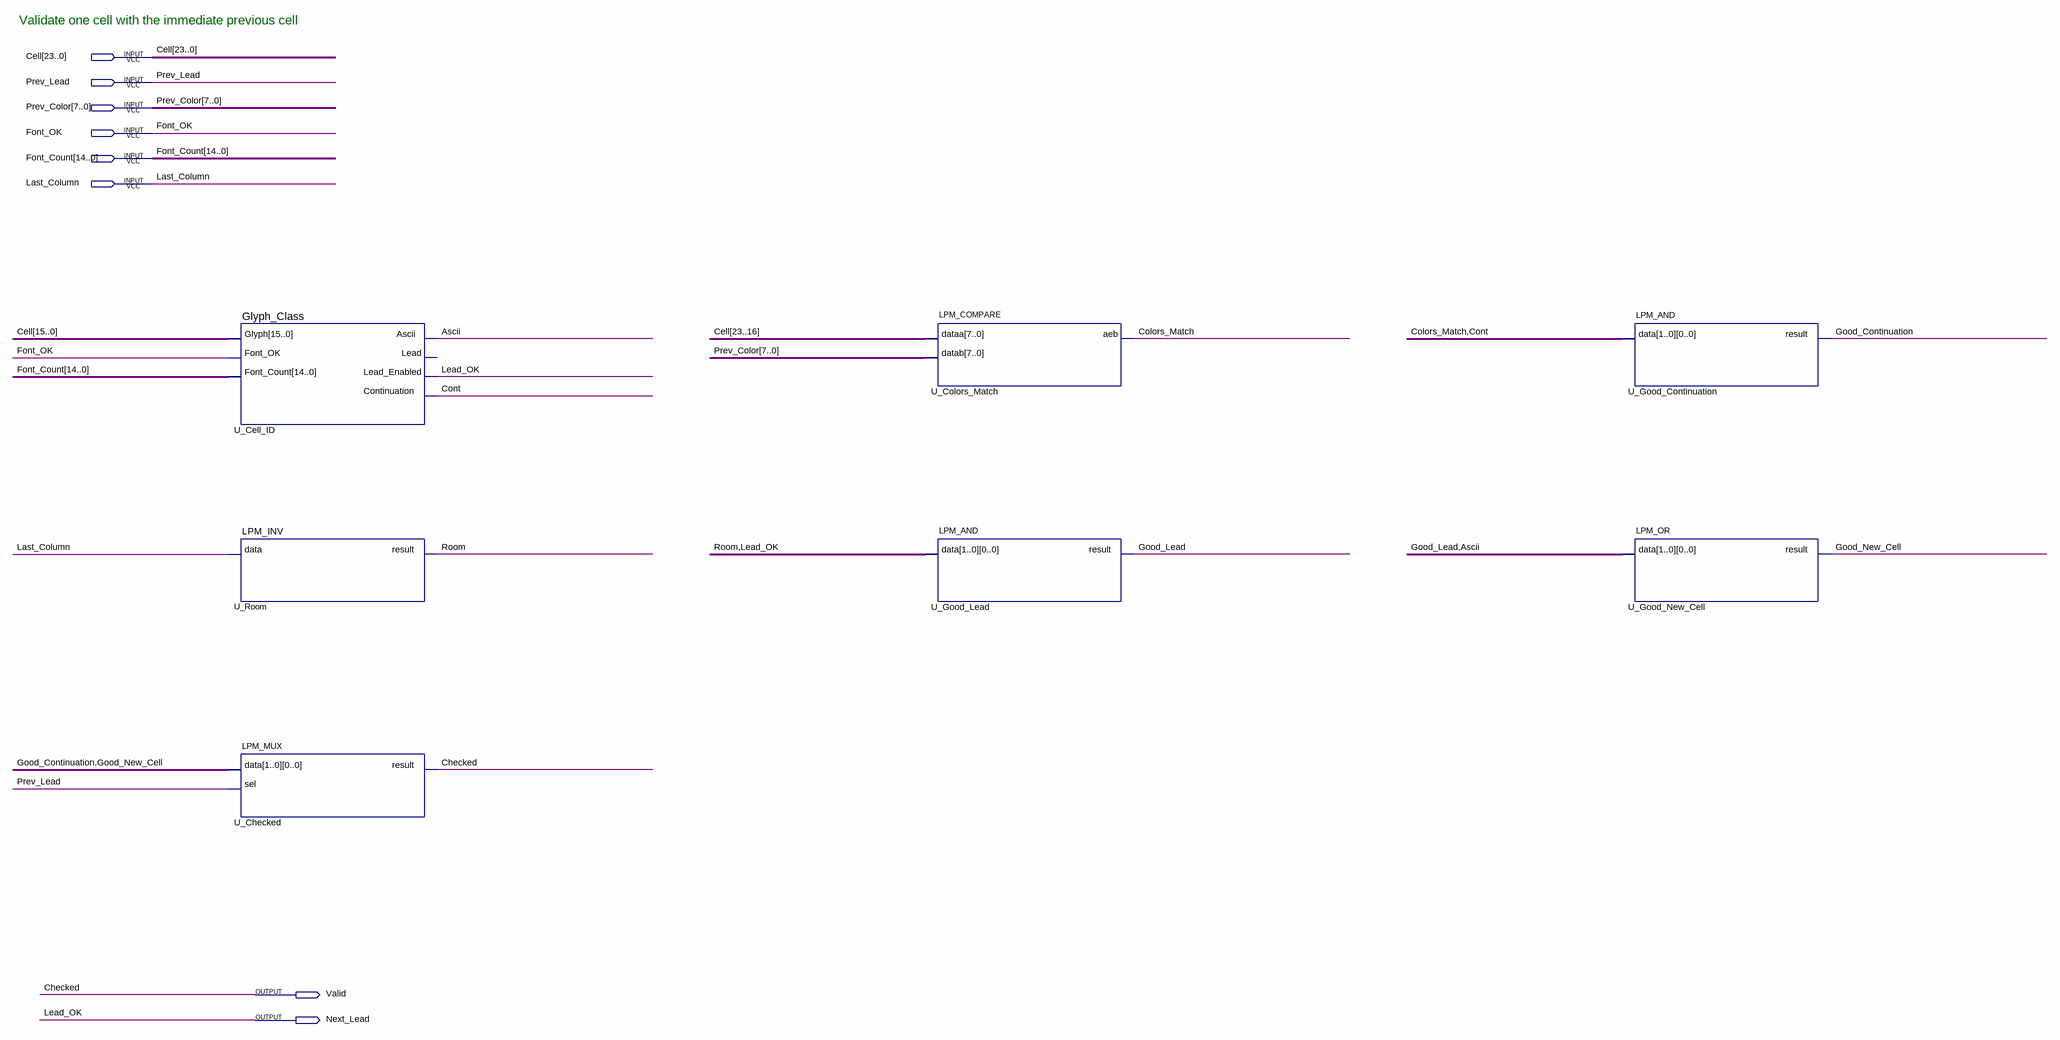
[diagram p0: schematic sheet]
// Quartus schematic Row_Check.bdf as structural Verilog: 7 symbols, 8 pins
module Row_Check (
  input  [23:0] Cell,
  input  Prev_Lead,
  input  [7:0] Prev_Color,
  input  Font_OK,
  input  [14:0] Font_Count,
  input  Last_Column,
  output Valid,
  output Next_Lead
);

  wire Ascii, Colors_Match, Cont, Good_Continuation, Good_Lead, Good_New_Cell, Room;

  Glyph_Class U_Cell_ID (
    .Glyph(Cell[15:0]), .Font_OK(Font_OK), .Font_Count(Font_Count), .Ascii(Ascii), .Lead_Enabled(Next_Lead),
    .Continuation(Cont));  // open: Lead
  LPM_INV #(.LPM_WIDTH(1)) U_Room (.data(Last_Column), .result(Room));
  LPM_MUX #(.LPM_WIDTH(1), .LPM_SIZE(2), .LPM_WIDTHS(1)) U_Checked (
    .data({Good_Continuation, Good_New_Cell}), .sel(Prev_Lead), .result(Valid));
  LPM_COMPARE #(.LPM_WIDTH(8), .LPM_REPRESENTATION("UNSIGNED")) U_Colors_Match (
    .dataa(Cell[23:16]), .datab(Prev_Color), .aeb(Colors_Match));
  LPM_AND #(.LPM_WIDTH(1), .LPM_SIZE(2)) U_Good_Lead (.data({Room, Next_Lead}), .result(Good_Lead));
  LPM_AND #(.LPM_WIDTH(1), .LPM_SIZE(2)) U_Good_Continuation (.data({Colors_Match, Cont}), .result(Good_Continuation));
  LPM_OR #(.LPM_WIDTH(1), .LPM_SIZE(2)) U_Good_New_Cell (.data({Good_Lead, Ascii}), .result(Good_New_Cell));

  // Other names for the same wires on the sheet: Checked = Valid; Lead_OK = Next_Lead

  // Notes on the sheet:
  //   Validate one cell with the immediate previous cell
endmodule
